# Altium schematic sheet Pump-Power.SchDoc
size A4; SheetNumber: 4
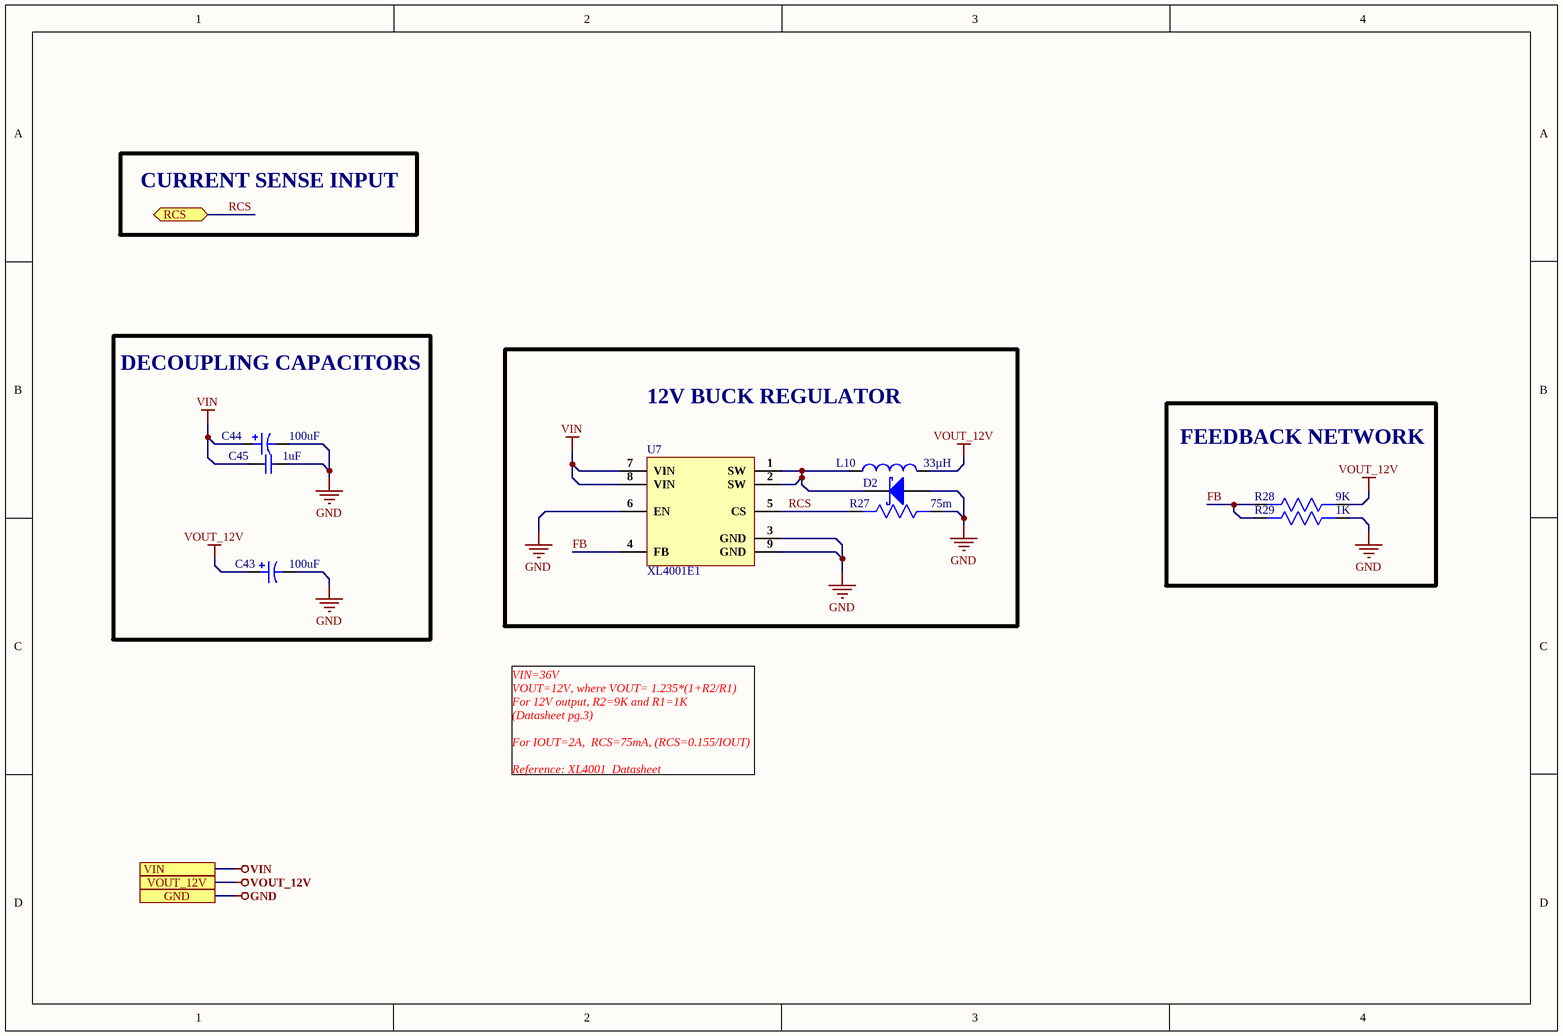
[diagram p0: Pump-Power.SchDoc]

## Parts
C43  100uF  [VKMB1001E101MV]
C44  100uF  [VKMD1001J101MV]
C45  1uF  [Cap0805]
D2  PMEG3030EP,115  [PMEG3030EP,115]  (value not drawn)
L10  33µH  [ETQ-P4M330YFN]
R27  75m  [RES 2512]
R28  9K  [RES 0805]
R29  1K  [Res0603]
U7  XL4001E1  [XL4001E1]

## Blocks framed on the sheet
DECOUPLING CAPACITORS: C43-C45
12V BUCK REGULATOR: D2 L10 R27 U7
FEEDBACK NETWORK: R28 R29

## Ports
GND, RCS (bidir), VIN, VOUT_12V

## Nets
GND: C43.2 C44.2 C45.2 D2.1(A) R27.1 R29.1 U7.3(GND) U7.6(EN) U7.9(GND) ; port GND
VIN: C44.1 C45.1 U7.7(VIN) U7.8(VIN) ; port VIN
VOUT_12V: C43.1 L10.2 R28.1 ; port VOUT_12V
FB: R28.2 R29.2 U7.4(FB)
RCS: R27.2 U7.5(CS) ; port RCS
NetD2_2: D2.2(K) L10.1 U7.1(SW) U7.2(SW)

## Notes on the sheet
- CURRENT SENSE INPUT
- VIN=36V
  VOUT=12V, where VOUT= 1.235*(1+R2/R1)
  For 12V output, R2=9K and R1=1K
  (Datasheet pg.3)
  For IOUT=2A,  RCS=75mA, (RCS=0.155/IOUT)
  Reference: XL4001  Datasheet

## Library data of the parts
C43 = VKMB1001E101MV: 25V 5mm 10mm 100uF 100kHz SMD,5x10mm Aluminum Electrolytic Cap- SMD ROHS; Manufacturer: Ymin; Manufacturer Part No: VKMB1001E101MV; Value: 100uF; Voltage: 25V; ComponentLink1Description: LCSC; ComponentLink1URL: https://lcsc.com/product-detail/Aluminum-Electrolytic-Capacitors-SMD_Ymin-VKMB1001E101MV_C487322.html
C44 = VKMD1001J101MV: 63V 10mm 8mm 100uF ±20% ,8x10mm Aluminum Electrolytic Cap; Manufacturer: Ymin; Manufacturer Part No: VKMD1001J101MV; Value: 100uF; Voltage: 63V; ComponentLink1Description: LCSC; ComponentLink1URL: https://lcsc.com/product-detail/Aluminum-Electrolytic-Capacitors-SMD_Ymin-VKMD1001J101MV_C487384.html
C45 = GCM21BC72A105KE36L: CAP CER 1UF 100V X7S 0805; Manufacturer: Murata; Tolerance: 10%; Supplier 1: Digi-Key; Manufacturer Part Number: GCM21BC72A105KE36L; RoHS: Yes; Category: Ceramic Capacitors; Stock 1: 179138; Pricing 1: 1=0.48000, 10=0.34100, 50=0.25800, 100=0.22480, 500=0.16650, 1000=0.14152 (USD); Mount: Surface Mount; Case/Package: 0805; Case Code (Imperial): 0805; Case Code (Metric): 2012; Min Operating Temperature: -55°C; Max Operating Temperature: 125°C; Packaging: Cut Tape; Capacitance: 1uF; Voltage Rating: 100V; Ratings: AEC-Q200; RoHS Compliant: Yes; ComponentLink1URL: http://search.murata.co.jp/Ceramy/image/img/A01X/partnumbering_e_02.pdf?src-supplier=Digi-Key; ComponentLink1Description: http://search.murata.co.jp/Ceramy/image/img/A01X/partnumbering_e_02.pdf?src-supplier=Digi-Key; Supplier Part Number 1: 490-14436-1-ND
D2 = PMEG3030EP,115: Diode Schottky 30V 3A 2-Pin SOD-128 T/R; Manufacturer: NXP Semiconductors; Manufacturer Part Number: PMEG3030EP-115; Max Reverse Current: 1.5mA; Peak Non-Repetitive Surge Current: 50A; Element Configuration: Single; Forward Voltage: 360mV; Power Dissipation: 625mW; Supplier 1: Newark; RoHS: Yes; Category: Rectifier Diodes; Mount: Surface Mount; Number of Pins: 2; Min Operating Temperature: -55°C; Max Operating Temperature: 150°C; Forward Current: 3A; Max Repetitive Reverse Voltage (Vrrm): 30V; Package Quantity: 1; Max Surge Current: 50A; Packaging: Tape and Reel; Average Rectified Current: 3A; Reverse Voltage: 30V; Max Reverse Voltage (DC): 30V; Series: -; Radiation Hardening: No; Lead Free: Lead Free; ComponentLink1URL: https://datasheet.ciiva.com/4453/pmeg3030ep-103074-4453360.pdf?src-supplier=Mouser; ComponentLink1Description: https://datasheet.ciiva.com/4453/pmeg3030ep-103074-4453360.pdf?src-supplier=Mouser; ComponentLink2URL: https://datasheet.ciiva.com/8299/pmeg3030ep-8299156.pdf?src-supplier=Avnet; ComponentLink2Description: https://datasheet.ciiva.com/8299/pmeg3030ep-8299156.pdf?src-supplier=Avnet; ComponentLink3URL: https://datasheet.ciiva.com/917/pmeg3030ep-917049.pdf?src-supplier=Digi-Key; ComponentLink3Description: https://datasheet.ciiva.com/917/pmeg3030ep-917049.pdf?src-supplier=Digi-Key; ComponentLink4URL: https://datasheet.ciiva.com/917/pmeg3030ep-917048.pdf?src-supplier=Digi-Key; ComponentLink4Description: https://datasheet.ciiva.com/917/pmeg3030ep-917048.pdf?src-supplier=Digi-Key; ComponentLink5URL: https://datasheet.ciiva.com/917/pmeg3030ep-917050.pdf?src-supplier=Digi-Key; ComponentLink5Description: https://datasheet.ciiva.com/917/pmeg3030ep-917050.pdf?src-supplier=Digi-Key; ComponentLink6URL: https://datasheet.ciiva.com/8299/pmeg3030ep-8299301.pdf?src-supplier=Avnet; ComponentLink6Description: https://datasheet.ciiva.com/8299/pmeg3030ep-8299301.pdf?src-supplier=Avnet; Supplier Part Number 1: 85W3397
L10 = ETQ-P4M330YFN: FIXED IND 33UH 2.5A 189.2MOHM SM; Manufacturer: Panasonic; Core Material: Metal,Composite; Tolerance: 20%; Saturation Current: 4.1A; Shielding: Shielded; DC Resistance (DCR): 189.2mR; Test Frequency: 100kHz; Supplier 1: Digi-Key; Manufacturer Part Number: ETQ-P4M330YFN; RoHS: No; Category: Fixed Inductors; Stock 1: 482; Pricing 1: 1=1.56000, 10=1.44400, 25=1.33320, 50=1.11100, 100=1.04430, 250=0.93324 (USD); Mount: Surface Mount; Case/Package: SMD/SMT; Min Operating Temperature: -40°C; Max Operating Temperature: 150°C; Packaging: Tape and Reel; Inductance: 33uH; Current Rating: 2.5A; Ratings: AEC-Q200; ComponentLink1URL: https://industrial.panasonic.com/cdbs/www-data/pdf/AGL0000/AGL0000C59.pdf?src-supplier=Digi-Key; ComponentLink1Description: https://industrial.panasonic.com/cdbs/www-data/pdf/AGL0000/AGL0000C59.pdf?src-supplier=Digi-Key; Supplier Part Number 1: P122549CT-ND
R27 = CSRN2512FK75L0: RES 0.075 OHM 1% 2W 2512; Manufacturer: Stackpole Electronics; Resistance: 75mR; Temperature Coefficient: 200ppm/°C; Supplier 1: Digi-Key; Manufacturer Part Number: CSRN2512FK75L0; RoHS: Yes; Category: Chip SMD Resistors; Stock 1: 153268; Pricing 1: 1=0.58000, 10=0.42500, 25=0.34480, 50=0.30000, 100=0.24750, 250=0.21500, 500=0.17500 (USD); Mount: Surface Mount; Case/Package: 2512; Case Code (Metric): 6432; Case Code (Imperial): 2512; Min Operating Temperature: -55°C; Max Operating Temperature: 155°C; Tolerance: 1%; Packaging: Tape and Reel; Resistor Type: Thick Film; Number of Terminations: 2; Max Power Dissipation: 2W; Series: CSRN; Length: 0.25inch; Width: 0.124inch; Height: 0.028inch; Lead Free: Lead Free; RoHS Compliant: Yes; ComponentLink1URL: https://www.seielect.com/catalog/SEI-Packaging.pdf?src-supplier=Digi-Key; ComponentLink1Description: https://www.seielect.com/catalog/SEI-Packaging.pdf?src-supplier=Digi-Key; ComponentLink2URL: https://www.seielect.com/Catalog/SEI-CSR_CSRN.pdf?src-supplier=Digi-Key; ComponentLink2Description: https://www.seielect.com/Catalog/SEI-CSR_CSRN.pdf?src-supplier=Digi-Key; Supplier Part Number 1: CSRN2512FK75L0CT-ND
R28 = 0805W8F9001T5E: RES SMD 9kΩ ±100ppm/℃ 0.125W 0805; Manufacturer: UNI-ROYAL; Package: 0805; Resistance: 9K; Power(Watts): 0.125W
R29 = RC0603FR-071KL: RES SMD 1K OHM 1% 1/10W 0603; Manufacturer: Yageo; Resistance: 1kR; Temperature Coefficient: 100ppm/°C; Power Rating: 100mW; Voltage Rating: 50V; ComponentLink1URL: https://www.verical.com/server-webapp/html/getDatasheet?partID=409289&src-supplier=Verical; ComponentLink1Description: https://www.verical.com/server-webapp/html/getDatasheet?partID=409289&src-supplier=Verical; Supplier 1: Digi-Key; Manufacturer Part Number: RC0603FR-071KL; Stock 1: 21472395; Pricing 1: 1=0.1, 10=0.023, 100=0.0094, 1000=0.0042, 2500=0.0037 (USD); Case/Package: 0603; Contact Plating: Tin,Matte; Case Code (Imperial): 0603; Case Code (Metric): 1608; Min Operating Temperature: -55°C; Max Operating Temperature: 155°C; Tolerance: 1%; Composition: Thick Film; Packaging: Tape and Reel; Termination: SMD/SMT; Military Standard: Not; Length: 1.6mm; Height: 0.45mm; Depth: 0.8mm; Radiation Hardening: No; REACH SVHC: No SVHC; Lead Free: Lead Free; ComponentLink2URL: http://documents.rs-components.com/techlib://itc_doclist_GB.htm?stockno=5048928&src-supplier=RSComponents; ComponentLink2Description: http://documents.rs-components.com/techlib://itc_doclist_GB.htm?stockno=5048928&src-supplier=RSComponents; ComponentLink3URL: http://www.yageo.com/documents/recent/PYu-RC0603_51_RoHS_L_4.pdf?src-supplier=Avnet+Europe; ComponentLink3Description: http://www.yageo.com/documents/recent/PYu-RC0603_51_RoHS_L_4.pdf?src-supplier=Avnet+Europe; ComponentLink4URL: http://www.farnell.com/datasheets/2167052.pdf?src-supplier=Element14; ComponentLink4Description: http://www.farnell.com/datasheets/2167052.pdf?src-supplier=Element14; ComponentLink5URL: http://www.farnell.com/datasheets/1868787.pdf?src-supplier=Element14; ComponentLink5Description: http://www.farnell.com/datasheets/1868787.pdf?src-supplier=Element14; ComponentLink6URL: http://www.yageo.com/documents/recent/PYu-RC_Group_51_RoHS_L_2.pdf?src-supplier=Avnet; ComponentLink6Description: http://www.yageo.com/documents/recent/PYu-RC_Group_51_RoHS_L_2.pdf?src-supplier=Avnet; ComponentLink7URL: https://www.verical.com/server-webapp/html/getDatasheet?partID=404327&src-supplier=Verical; ComponentLink7Description: https://www.verical.com/server-webapp/html/getDatasheet?partID=404327&src-supplier=Verical; ComponentLink8URL: http://www.farnell.com/datasheets/443971.pdf?src-supplier=Element14; ComponentLink8Description: http://www.farnell.com/datasheets/443971.pdf?src-supplier=Element14; Supplier Part Number 1: 311-1.00KHRDKR-ND
U7 = XL4001E1: 2A 40V SOIC-8_EP_150mil DC-DC Converters ROHS; Manufacturer: XLSEMI; Value: Custom; Manufacturer Part No: XL4001E1; Package: SOIC-8; ComponentLink1Description: LCSC; ComponentLink1URL: https://www.lcsc.com/product-detail/DC-DC-Converters_XLSEMI-XL4001E1_C73347.html